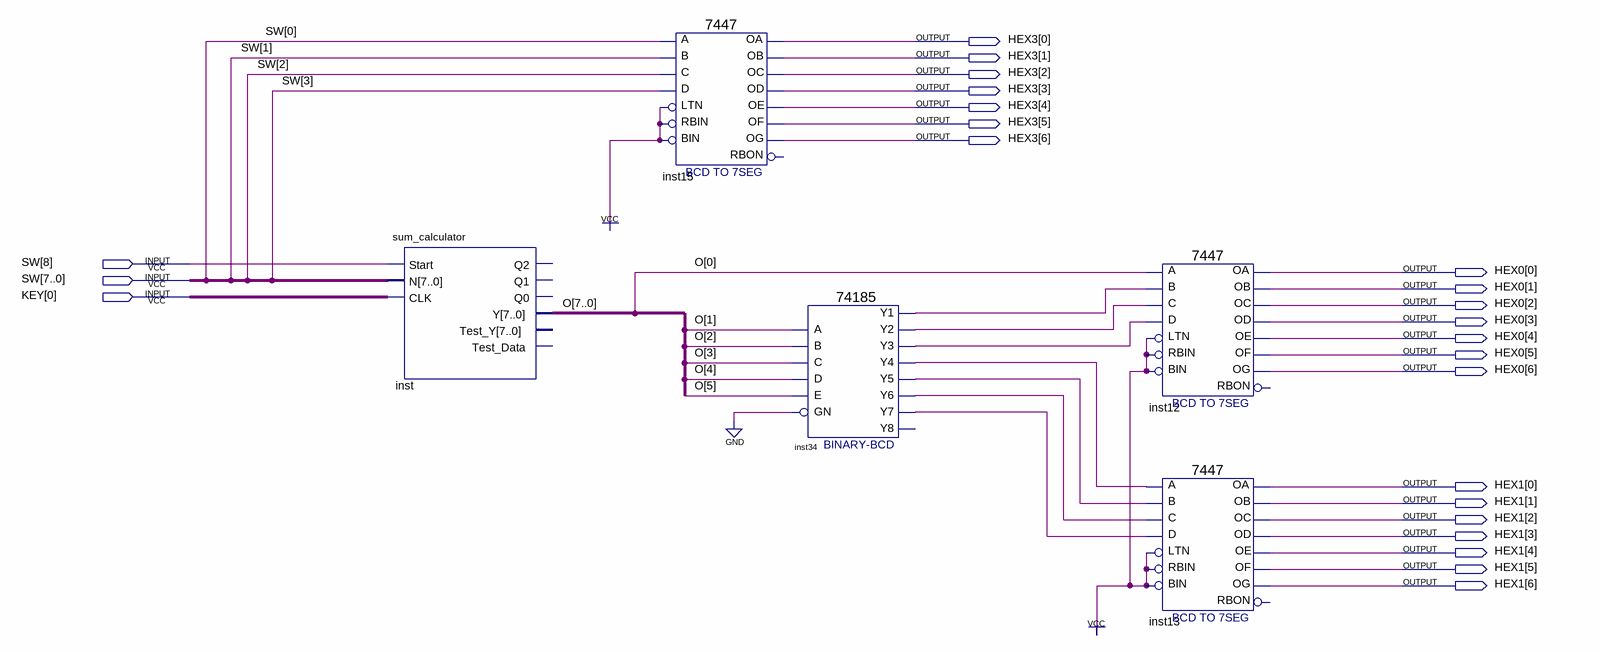
[diagram p0: schematic sheet]
// Quartus schematic cau01_kit.bdf as structural Verilog: 5 symbols, 24 pins
module cau01_kit (
  input  [8:0] SW,
  input  [0:0] KEY,
  output [6:0] HEX3,
  output [6:0] HEX0,
  output [6:0] HEX1
);

  wire inst34_y1, inst34_y2, inst34_y3, inst34_y4, inst34_y5, inst34_y6, inst34_y7;
  wire [7:0] O;

  sum_calculator inst (.Start(SW[8]), .N(SW[7:0]), .CLK(KEY[0]), .Y(O));  // open: Q2, Q1, Q0, Test_Y, Test_Data
  \7447  inst15 (
    .LTN(1'b1), .B(SW[1]), .C(SW[2]), .D(SW[3]), .RBIN(1'b1), .BIN(1'b1), .A(SW[0]), .OB(HEX3[1]),
    .OC(HEX3[2]), .OE(HEX3[4]), .OD(HEX3[3]), .OF(HEX3[5]), .OG(HEX3[6]), .OA(HEX3[0]));  // open: RBON
  \74185  inst34 (
    .A(O[1]), .B(O[2]), .D(O[4]), .C(O[3]), .E(O[5]), .GN(1'b0), .Y1(inst34_y1), .Y3(inst34_y3),
    .Y2(inst34_y2), .Y5(inst34_y5), .Y4(inst34_y4), .Y6(inst34_y6), .Y7(inst34_y7));  // open: Y8
  \7447  inst12 (
    .LTN(1'b1), .B(inst34_y1), .C(inst34_y2), .D(inst34_y3), .RBIN(1'b1), .BIN(1'b1), .A(O[0]), .OB(HEX0[1]),
    .OC(HEX0[2]), .OE(HEX0[4]), .OD(HEX0[3]), .OF(HEX0[5]), .OG(HEX0[6]), .OA(HEX0[0]));  // open: RBON
  \7447  inst13 (
    .LTN(1'b1), .B(inst34_y5), .C(inst34_y6), .D(inst34_y7), .RBIN(1'b1), .BIN(1'b1), .A(inst34_y4),
    .OB(HEX1[1]), .OC(HEX1[2]), .OE(HEX1[4]), .OD(HEX1[3]), .OF(HEX1[5]), .OG(HEX1[6]), .OA(HEX1[0]));  // open: RBON
endmodule
